# EasyEDA Pro project climbsnail-spotwelder-45c7d2f7.epro, board SpotWelder_Mini
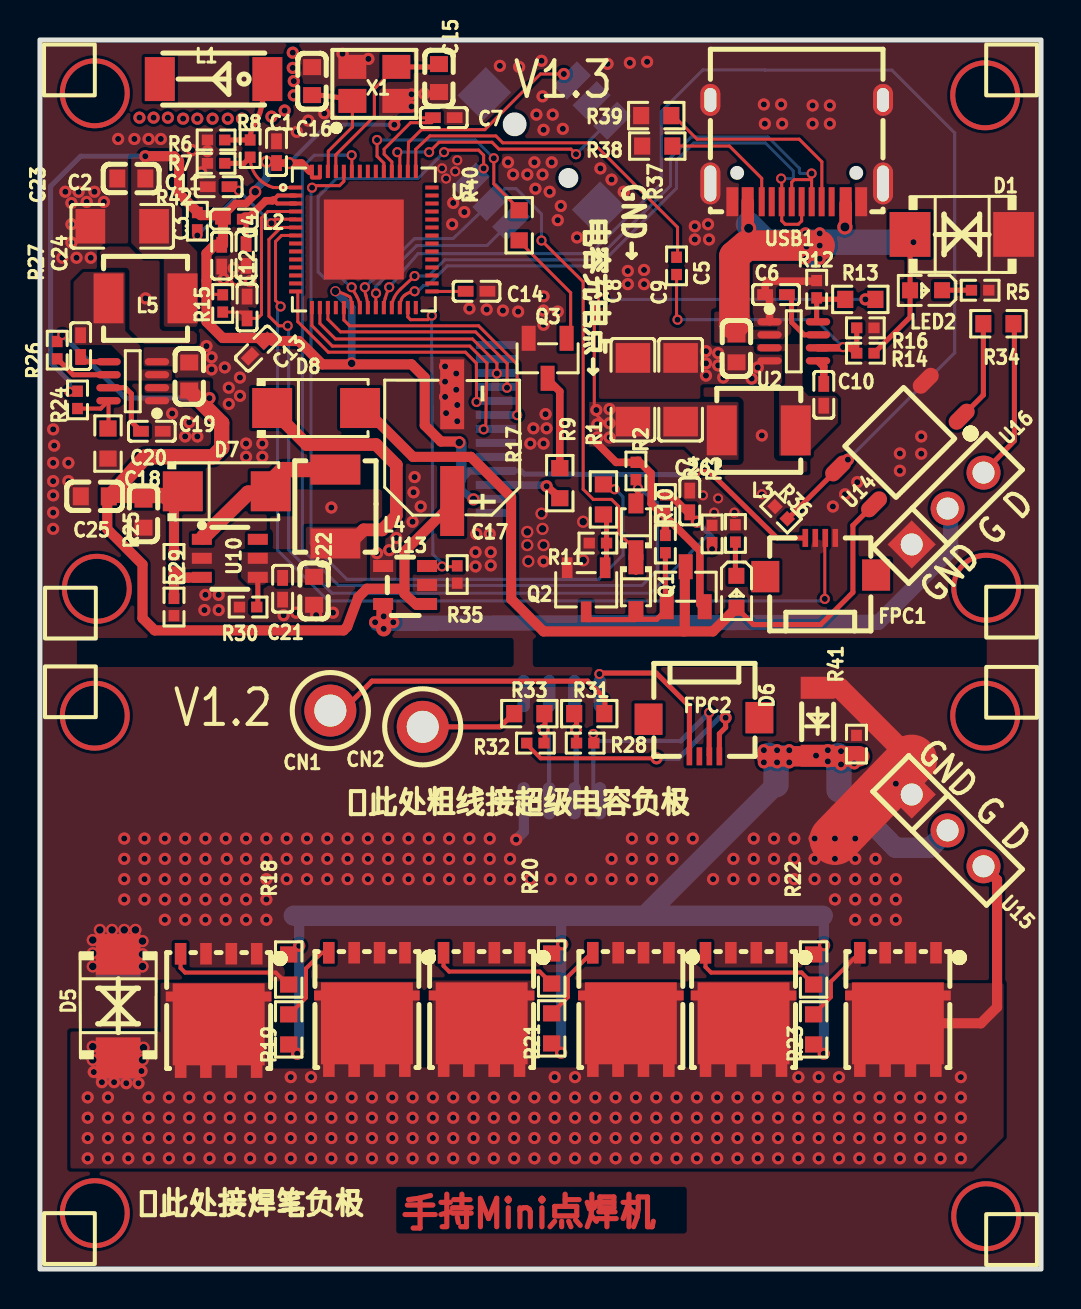
[diagram p14: board, top side]
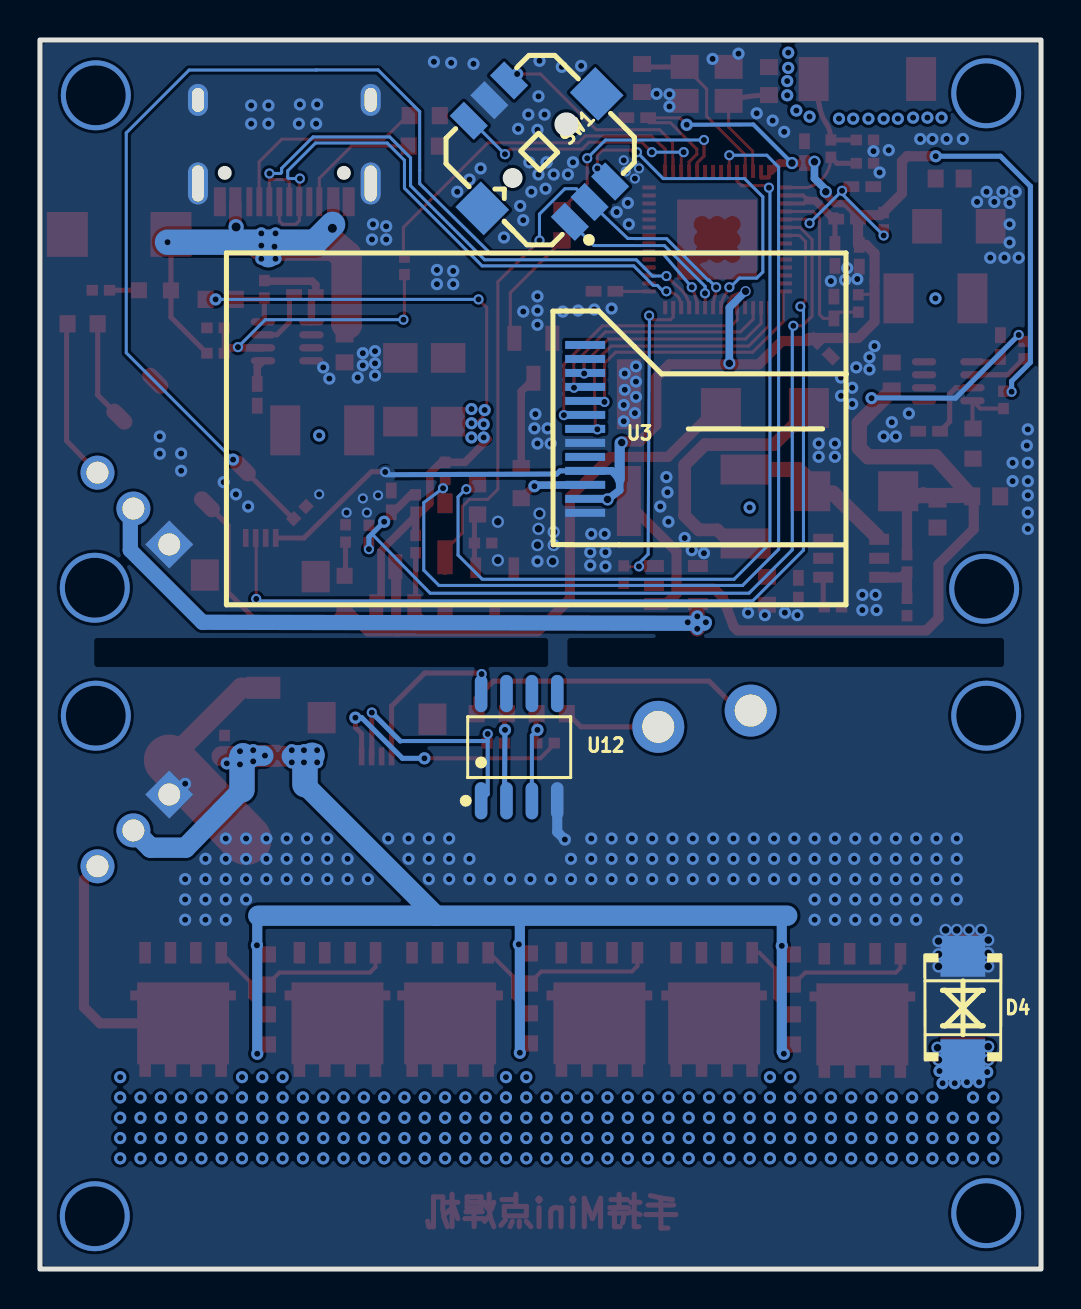
[diagram p15: board, bottom side, seen from below]

Outline 50.09 x 61.49 mm; copper layers: Top Layer, Bottom Layer. Coordinates in mm from the lower left corner of the outline.
Outline path: rectangle 0,61.49 50.09,0
Stack: Top Layer 0.035mm / Dielectric1 1.51mm FR4 er 4.5 / Bottom Layer 0.035mm

## Design rules (mm)
net IO20: DP1
net IO19: DP1
spacing safeClearance (default): track to track 0.152, other pairs 0.152 to 0.3
spacing Plane_innerPlane: track to track 0.152, other pairs 0.152 to 0.3
spacing Copper_copperRegion: track to track 0.152, other pairs 0.152 to 0.3
spacing Copper_GND: track to track 0.152, other pairs 0.152 to 0.3
track width trackWidth (default): min 0.127, default 0.254, max 2.54
differential pair differentialPair (default): width min 0.127, default 0.254, max 2.54; gap min 0.102, default 0.152
net GND uses GND
net $1N673 uses GND
net VBUS uses GND
net $1N86985 uses GND
net 3V3 uses GND
net TFT_DC uses GND
pour e905 uses Copper_GND, copperRegion_Copper_GND
pour e916 uses Copper_GND, copperRegion_Copper_GND
pour e918 uses Copper_copperRegion, copperRegion_Copper_copperRegion
pour e920 uses Copper_GND, copperRegion_Copper_GND
pour e922 uses Copper_GND, copperRegion_Copper_GND
pour e924 uses Copper_copperRegion, copperRegion_Copper_copperRegion
pour e926 uses Copper_GND, copperRegion_Copper_GND
pour e928 uses Copper_copperRegion, copperRegion_Copper_copperRegion
pour e930 uses Copper_copperRegion, copperRegion_Copper_copperRegion
pour e932 uses Copper_copperRegion, copperRegion_Copper_copperRegion
pour e934 uses Copper_GND, copperRegion_Copper_GND
pour e936 uses Copper_GND, copperRegion_Copper_GND
pour e938 uses Copper_GND, copperRegion_Copper_GND

## Placement (name value [footprint] x y rotation side)
C1  100nF  [C0402]  11.84 55.88 90 top
C2  1uF  [C0603]  4.57 54.56 0 top
C3  100nF  [C0402]  9.09 50.7 90 top
C4  100nF  [C0402]  10.31 50.74 90 top
C5  10uF  [C0603]  34.85 46.06 90 top
C6  100nF  [C0402]  36.83 48.76 180 top
C7  100nF  [C0402]  20.2 57.61 180 top
C8  22uF  [C1206]  29.67 43.99 270 top
C9  22uF  [C1206]  32.05 43.99 270 top
C10  100nF  [C0402]  39.22 43.74 270 top
C11  100nF  [C0402]  8.94 54.15 0 top
C12  1uF  [C0402]  10.36 48.11 270 top
C13  100nF  [C0402]  10.9 46.05 225 top
C14  100nF  [C0402]  21.84 48.92 180 top
C15  22pF  [C0603]  19.96 59.59 90 top
C16  22pF  [C0603]  13.61 59.44 90 top
C17  16V/220uF  [CAP-SMD_BD6.3-L6.6-W6.6-FD]  20.62 41.1 90 top
C18  10uF  [C0603]  5.18 37.8 90 top
C19  10uF  [C0603]  7.47 44.65 270 top
C20  100nF  [C0402]  5.6 41.92 0 top
C21  100nF  [C0402]  12.14 34.04 90 top
C22  10uF  [C0603]  13.72 33.93 90 top
C23  22uF  [C1206]  4.11 52.17 0 top
C24  100nF  [C0402]  2.03 46.18 90 top
C25  10uF  [C0603]  2.74 38.66 0 top
C26  1uF  [C0402]  32.51 38.4 270 top
CN1  5006  [TH_BD3.2-D2.0]  14.53 27.94 0 top
CN2  5006  [TH_BD3.2-D2.0]  19.15 27.13 0 top
D1  SMBJ5.0CA  [SMB_L4.6-W3.6-LS5.3-BI]  46.13 51.77 0 top
D2  1N4148WS  [SOD-323_L1.8-W1.3-LS2.5-RD]  29.82 37.13 90 top
D3  1N4148WS  [SOD-323_L1.8-W1.3-LS2.5-RD]  29.82 34.09 270 top
D4  SMBJ28CA双向TVS管  [SMB_L4.6-W3.6-LS5.3-BI]  3.91 13.06 90 bottom
D5  SMBJ28CA双向TVS管  [SMB_L4.6-W3.6-LS5.3-BI]  3.91 13.16 90 top
D6  ZMM18  [LL-34_L3.5-W1.5-RD]  38.91 27.38 90 top
D7  SS34  [SMA_L4.3-W2.6-LS5.2-RD]  9.35 38.91 0 top
D8  SS34  [SMA_L4.3-W2.6-LS5.2-RD]  13.82 43.08 0 top
FPC1  X05A12H04G  [FPC-SMD_4P-P0.50_XKB_X05A12H04G]  39.06 35.61 0 top
FPC2  X05A12H04G  [FPC-SMD_4P-P0.50_XKB_X05A12H04G]  33.22 26.62 180 top
L1  AN2051-245  [ANT2051]  8.69 59.54 180 top
L2  2nH  [L0402]  9.7 52.53 0 top
L3  2.2uH  [IND-SMD_L4.2-W4.2-C133189]  35.97 41.96 0 top
L4  4.7uH  [IND-SMD_L4.5-W4.0-1]  14.78 38.15 90 top
L5  2.2uH  [IND-SMD_L4.2-W4.2-C133189]  5.28 48.56 180 top
LED1  -  [LED0603-RD_BLUE]  34.85 33.88 270 top
LED2  -  [LED0603-RD_BLUE]  44.34 48.97 180 top
Q1  AO3415  [SOT-23-3_L2.9-W1.3-P1.90-LS2.4-BR]  32.31 34.14 270 top
Q2  S8050 J3Y  [SOT-23-3_L3.0-W1.7-P0.95-LS2.9-BR]  27.33 33.99 90 top
Q3  S8050  [SOT-23-3_L2.9-W1.3-P1.90-LS2.4-BR]  25.4 45.57 90 top
R1  10K  [R0402]  29.82 39.93 90 top
R2  200K  [R0402]  31.29 38.3 270 top
R3  10K  [R0402]  34.8 36.8 90 top
R4  200K  [R0402]  33.63 36.78 270 top
R5  10K  [R0402]  47.04 48.97 180 top
R6  TBD  [R0402]  8.81 56.49 0 top
R7  TBD  [R0402]  8.81 55.32 0 top
R8  0R  [R0402]  10.52 56.06 270 top
R9  1K  [R0603]  28.19 38.51 270 top
R10  10K  [R0402]  31.29 36.27 270 top
R11  10K  [R0402]  27.92 36.32 0 top
R12  10K  [R0402]  38.86 49.02 90 top
R13  38.3K  [R0603]  41.05 48.51 0 top
R14  10K  [R0402]  41.3 45.82 0 top
R15  10K  [R0402]  9.14 48.31 90 top
R16  10K  [R0402]  41.3 47.09 180 top
R17  10R  [R0603]  26.01 39.32 90 top
R18  20R  [R0603]  12.45 14.99 270 top
R19  20R  [R0603]  12.45 11.99 90 top
R20  20R  [R0603]  25.6 15.04 270 top
R21  20R  [R0603]  25.6 12.04 90 top
R22  20R  [R0603]  38.71 14.99 270 top
R23  20R  [R0603]  38.71 11.99 90 top
R24  8.87K  [R0603]  3.4 41.3 90 top
R25  200K  [R0402]  6.71 35.31 90 top
R26  40.2K  [R0402]  1.88 43.48 270 top
R27  200K  [R0402]  0.86 45.97 90 top
R28  200K  [R0402]  27.28 26.31 180 top
R29  10K  [R0402]  6.71 33.12 90 top
R30  200K  [R0402]  10.41 33.12 0 top
R31  1K  [R0603]  27.48 27.79 0 top
R32  200K  [R0402]  24.79 26.31 180 top
R33  1K  [R0603]  24.49 27.79 0 top
R34  1K  [R0603]  47.96 47.29 180 top
R35  10K  [R0402]  20.88 34.75 90 top
R36  10K  [R0402]  37.08 37.85 315 top
R37  NC  [R0402]  31.85 50.19 270 top
R38  1K  [R0603]  30.89 56.18 180 top
R39  1K  [R0603]  30.84 57.71 180 top
R40  1K  [R0603]  23.98 52.22 90 top
R41  10K  [R0402]  40.85 26.26 270 top
R42  10K  [R0402]  7.87 52.43 90 top
SW1  TM-4175-B-A  [SW-SMD_TM-4175-B-X]  25.09 55.93 45 bottom
U1  ESP32-S3FH4R2  [QFN-56_L7.0-W7.0-P0.40-TL-EP4.0]  16.21 51.51 0 top
U2  -  [TSOT-23-8_L2.9-W1.6-P0.65-LS2.8-BR]  37.72 46.42 180 top
U3  -  [1.14TFT焊接式B]  25.26 42.03 180 bottom
U4  NCEP30T21GU  [DFN-8_L5.8-W5.1-P1.27-LS5.9-BL]  8.94 12.94 180 top
U5  NCEP30T21GU  [DFN-8_L5.8-W5.1-P1.27-LS5.9-BL]  16.36 12.99 180 top
U6  NCEP30T21GU  [DFN-8_L5.8-W5.1-P1.27-LS5.9-BL]  22.1 12.99 180 top
U7  NCEP30T21GU  [DFN-8_L5.8-W5.1-P1.27-LS5.9-BL]  29.57 12.99 180 top
U8  NCEP30T21GU  [DFN-8_L5.8-W5.1-P1.27-LS5.9-BL]  35.2 12.99 180 top
U9  NCEP30T21GU  [DFN-8_L5.8-W5.1-P1.27-LS5.9-BL]  42.93 12.99 180 top
U10  SX1308  [SOT-23-6_L2.9-W1.6-P0.95-LS2.8-BR]  9.5 35.56 180 top
U11  -  [TSOT-23-8_L2.9-W1.6-P0.65-LS2.8-BR]  4.64 44.42 0 top
U12  GS8332-SR  [SOP-8_L4.9-W3.9-P1.27-LS6.0-BL]  26.11 26.11 180 bottom
U13  UCC27517DBVT  [SOT-23-5_L2.9-W1.6-P0.95-LS2.8-BR]  18.27 34.22 0 top
U14  CT185GB(T1)  [SOP-4_L4.4-W3.6-P2.54-LS7.0-TL]  43.03 41.35 225 top
U15  A2541WV-3P  [HDR-TH_3P-P2.54-V-M]  45.41 21.95 315 top
U16  A2541WV-3P  [HDR-TH_3P-P2.54-V-M]  45.41 38.05 45 top
USB1  TYPEC-304-BCP16  [USB-C-SMD_TYPEC-304-BCP16]  37.86 55.95 180 top
X1  40MHz  [OSC-SMD_4P-L3.2-W2.5-BL_SIT8008BI]  16.73 59.3 0 top

## Footprints (pads in the part's own frame, mm; a bottom-side part is the same pattern mirrored in y, then rotated)
1.14TFT焊接式B
  rect 2x0.4 smd: 1(2.451,4.2) 2(2.451,3.5) 3(2.451,2.8) 4(2.451,2.1) 5(2.451,1.4) 6(2.451,0.7) 7(2.451,0) 8(2.451,-0.7) 9(2.451,-1.4) 10(2.451,-2.1) 11(2.451,-2.8) 12(2.451,-3.5) 13(2.451,-4.2)
ANT2051
  rect 1.5x2.2 smd: 1(-2.69,0) 2(2.69,0)
C0402
  rect 0.79x0.54 smd: 1(-0.545,0) 2(0.545,0)
C0603
  rect 0.8x0.9 smd: 1(-0.7,0) 2(0.7,0)
C1206
  rect 1.485x1.728 smd: 1(-1.593,0) 2(1.593,0)
CAP-SMD_BD6.3-L6.6-W6.6-FD
  rect 3.5x1.2 smd: 1(-2.67,0) 2(2.67,0)
DFN-8_L5.8-W5.1-P1.27-LS5.9-BL
  rect 0.58x1.079 smd: 1(-1.905,-2.834) 2(-0.635,-2.834) 3(0.635,-2.834) 4(1.905,-2.834)
  rect 0.58x1.08 smd: 5(1.9,2.834) 6(0.64,2.834) 7(-0.63,2.834) 8(-1.9,2.834)
  rect 0.95x0.5 smd: 9(-2.169,-0.7) 9(2.169,-0.7)
  rect 4.6x4.1 smd: 9(0,0.695)
FPC-SMD_4P-P0.50_XKB_X05A12H04G
  rect 0.28x0.9 smd: 1(-0.772,0.968) 2(-0.272,0.968) 3(0.228,0.968) 4(0.728,0.968)
  rect 1.4x1.57 smd: 5(-2.772,-0.968) 6(2.772,-0.889)
HDR-TH_3P-P2.54-V-M
  rect 1.7x1.7 hole 1.1: 1(-2.54,0)
  round 1.7 hole 1.1: 2(0,0) 3(2.54,0)
IND-SMD_L4.2-W4.2-C133189
  rect 1.5x2.5 smd: 1(-1.85,0) 2(1.85,0)
IND-SMD_L4.5-W4.0-1
  rect 1.501x2.499 smd: 1(-1.849,0) 2(1.849,0)
L0402
  rect 0.79x0.54 smd: 1(-0.545,0) 2(0.545,0)
LED0603-RD_BLUE
  rect 0.8x0.8 smd: 1(-0.8,-0.003) 2(0.8,0.003)
LL-34_L3.5-W1.5-RD
  rect 1.1x1.7 smd: 1(-1.7,0) 2(1.7,0)
OSC-SMD_4P-L3.2-W2.5-BL_SIT8008BI
  rect 1.399x1.199 smd: 1(-1.1,-0.851) 2(1.1,-0.851) 3(1.1,0.851) 4(-1.1,0.851)
QFN-56_L7.0-W7.0-P0.40-TL-EP4.0
  rect 0.665x0.2 smd: 1(-3.408,2.6) 2(-3.408,2.2) 3(-3.408,1.8) 4(-3.408,1.4) 5(-3.408,1) 6(-3.408,0.6) 7(-3.408,0.2) 8(-3.408,-0.2) 9(-3.408,-0.6) 10(-3.408,-1) 11(-3.408,-1.4) 12(-3.408,-1.8) 13(-3.408,-2.2) 14(-3.408,-2.6) 29(3.408,-2.6) 30(3.408,-2.2) 31(3.408,-1.8) 32(3.408,-1.4) 33(3.408,-1) 34(3.408,-0.6) 35(3.408,-0.2) 36(3.408,0.2) 37(3.408,0.6) 38(3.408,1) 39(3.408,1.4) 40(3.408,1.8) 41(3.408,2.2) 42(3.408,2.6)
  rect 0.2x0.665 smd: 15(-2.6,-3.408) 16(-2.2,-3.408) 17(-1.8,-3.408) 18(-1.4,-3.408) 19(-1,-3.408) 20(-0.6,-3.408) 21(-0.2,-3.408) 22(0.2,-3.408) 23(0.6,-3.408) 24(1,-3.408) 25(1.4,-3.408) 26(1.8,-3.408) 27(2.2,-3.408) 28(2.6,-3.408) 43(2.6,3.408) 44(2.2,3.408) 45(1.8,3.408) 46(1.4,3.408) 47(1,3.408) 48(0.6,3.408) 49(0.2,3.408) 50(-0.2,3.408) 51(-0.6,3.408) 52(-1,3.408) 53(-1.4,3.408) 54(-1.8,3.408) 55(-2.2,3.408) 56(-2.6,3.408)
  rect 4x4 smd: 57(0,0)
R0402
  rect 0.566x0.54 smd: 1(-0.433,0) 2(0.433,0)
R0603
  rect 0.806x0.864 smd: 1(-0.753,0) 2(0.753,0)
SMA_L4.3-W2.6-LS5.2-RD
  rect 2x2 smd: 1(-2.2,0) 2(2.2,0)
SMB_L4.6-W3.6-LS5.3-BI
  rect 2.047x2.241 smd: 1(-2.591,0) 2(2.591,0)
SOD-323_L1.8-W1.3-LS2.5-RD
  rect 1x0.75 smd: 1(-1.173,0) 2(1.173,0)
SOP-4_L4.4-W3.6-P2.54-LS7.0-TL
  oval 1.508x0.8 smd: 1(-3.1,1.27) 2(-3.1,-1.27) 3(3.1,-1.27) 4(3.1,1.27)
SOP-8_L4.9-W3.9-P1.27-LS6.0-BL
  oval 0.63x1.865 smd: 1(-1.905,-2.683) 2(-0.635,-2.683) 3(0.635,-2.683) 4(1.905,-2.683) 5(1.905,2.683) 6(0.635,2.683) 7(-0.635,2.683) 8(-1.905,2.683)
SOT-23-3_L2.9-W1.3-P1.90-LS2.4-BR
  rect 1.25x0.7 smd: 1(1,-0.95) 2(1,0.95) 3(-1,0)
SOT-23-3_L3.0-W1.7-P0.95-LS2.9-BR
  rect 1.038x0.532 smd: 1(1.101,-0.95) 2(1.101,0.95) 3(-1.101,0)
SOT-23-5_L2.9-W1.6-P0.95-LS2.8-BR
  rect 1.001x0.6 smd: 1(1.1,-0.95) 2(1.1,0) 3(1.1,0.95) 4(-1.1,0.95) 5(-1.1,-0.95)
SOT-23-6_L2.9-W1.6-P0.95-LS2.8-BR
  rect 1x0.55 smd: 1(1.4,-0.95) 2(1.4,0) 3(1.4,0.95) 4(-1.4,0.95) 5(-1.4,0) 6(-1.4,-0.95)
SW-SMD_TM-4175-B-X
  rect 1.7x1 smd: 1(-3.575,1.425) 2(-3.575,0.028) 3(-3.575,-1.425) 4(3.575,1.425) 5(3.575,-0.028) 6(3.575,-1.425)
  rect 2x1.8 smd: 7(0,-4.05) 7(0,4.05)
TH_BD3.2-D2.0
  round 2.6 hole 1.6: 1(0,0)
TSOT-23-8_L2.9-W1.6-P0.65-LS2.8-BR
  oval 1.222x0.363 smd: 1(1.212,-0.976) 2(1.212,-0.325) 3(1.212,0.325) 4(1.212,0.976) 5(-1.212,0.976) 6(-1.212,0.325) 7(-1.212,-0.325) 8(-1.212,-0.976)
USB-C-SMD_TYPEC-304-BCP16
  oval 1.001x2.1 hole 0.6x1.801: 13(-4.321,1.633) 14(4.321,1.633)
  oval 1.001x1.6 hole 0.6x1.199: 15(-4.321,-2.547) 16(4.321,-2.547)
  rect 0.6x1.45 smd: A1B12(-3.226,2.547) A4B9(-2.451,2.547) B1A12(3.22,2.547) B4A9(2.451,2.547)
  rect 0.299x1.45 smd: A5(-1.25,2.547) A6(-0.249,2.547) A7(0.249,2.547) A8(1.25,2.547) B5(1.75,2.547) B6(0.75,2.547) B7(-0.75,2.547) B8(-1.75,2.547)

## Nets
As in the schematic.

Pads without a net: FPC1 2 5 6; FPC2 3 5 6; L1 2; SW1 7; U1 8 9 10 11 12 13 28 30 31 32 33 34 35 36 37 38 39 40 41 42 48 49 50; U3 1 2 9; U10 6; U12 5 6 7; USB1 A8 B8

## Via types
v1: diameter 0.61, hole 0.305, Top Layer to Bottom Layer, 531 vias
v2: diameter 3.5, hole 3, Top Layer to Bottom Layer, 8 vias
v3: diameter 0.508, hole 0.305, Top Layer to Bottom Layer, 52 vias
v4: diameter 0.61, hole 0.381, Top Layer to Bottom Layer, 28 vias
v5: diameter 0.762, hole 0.457, Top Layer to Bottom Layer, 2 vias
v6: diameter 0.508, hole 0.381, Top Layer to Bottom Layer, 1 via

## Routing (per net, layer and track width the routed paths; a pad name or vN(x,y) marks a point on that pad's centre or on a via; arc(x,y) is an arc through that point)
3V3: length 1.3
  Top Layer w0.152: v6(14.78,48.92) arc(15.14,48.82) 15.48,48.66 arc(15.52,48.62) 15.54,48.56 arc(15.59,48.34) U1.20
  vias: v1(5.27,55.68) v1(17.73,57.25) v3(1.47,43.89) v3(32.82,39.88) v4(10.77,53.9) v4(11.34,55.4) v4(12.46,55.33) v4(15.6,45.31) v4(20.98,41.35) v4(21.69,38.51)
+12V:
  vias: v1(8.48,43.57) v3(1.12,46.74)
AGND:
  vias: v1(30.85,25.55) v1(34.31,27.58)
GND:
  vias: v1(0.66,42.01) v1(0.66,40.34) v1(0.66,39.42) v1(0.66,38.71) v1(0.66,37.85) v1(0.66,37.03) v1(0.71,41.2) v1(1.12,50.6) v1(1.27,53.9) v1(1.42,40.34) v1(1.42,39.42) v1(1.57,53.34) v1(1.57,52.27) v1(1.57,51.36) v1(1.83,50.6) v1(1.93,53.9) v1(2.34,53.39) v1(2.54,50.6) v1(2.72,53.9) v1(3.2,53.39) v1(3.91,56.54) v1(4.22,21.54) v1(4.22,20.52) v1(4.22,19.51) v1(4.22,18.49) v1(4.72,56.54) v1(5.23,21.54) v1(5.23,20.52) v1(5.23,19.51) v1(5.23,18.49) v1(5.44,56.54) v1(6.04,56.54) v1(6.25,21.54) v1(6.25,20.52) v1(6.25,19.51) v1(6.25,18.49) v1(6.25,17.48) v1(6.61,42.8) v1(7.26,41.66) v1(7.26,21.54) v1(7.26,20.52) v1(7.26,19.51) v1(7.26,18.49) v1(7.26,17.48) v1(7.47,42.37) v1(7.62,55.98) v1(7.87,41.66) v1(8.08,54.86) v1(8.28,33.73) v1(8.23,32.97) v1(8.28,21.54) v1(8.28,20.52) v1(8.28,19.51) v1(8.28,18.49) v1(8.28,17.48) v1(8.38,55.93) v1(8.33,46.18) v1(8.59,45.62) v1(8.59,45.01) v1(8.94,33.73) v1(8.94,32.97) v1(9.19,49.53) v1(9.25,45.11) v1(9.3,21.54) v1(9.3,19.51) v1(9.3,18.49) v1(9.3,17.48) v1(9.35,20.52) v1(9.45,44.09) v1(9.45,43.28) v1(9.7,50.08) v1(9.8,49.48) v1(10.01,44.6) v1(10.01,43.69) v1(10.31,41.3) v1(10.31,40.64) v1(10.31,21.54) v1(10.31,20.52) v1(10.31,19.51) v1(10.31,18.49) v1(10.31,17.48) v1(10.52,49.43) v1(11.12,41.3) v1(11.12,40.64) v1(11.33,21.54) v1(11.33,20.52) v1(11.33,19.51) v1(11.33,18.49) v1(11.33,17.48) v1(12.19,32.72) v1(12.34,21.54) v1(12.34,20.52) v1(12.34,19.51) v1(12.85,56.9) v1(12.82,32.84) v1(13.36,21.54) v1(13.36,20.52) v1(13.36,19.51) v1(13.43,57.46) v1(13.82,32.72) v1(14.23,57.82) v1(14.38,21.54) v1(14.38,20.52) v1(14.38,19.51) v1(14.66,32.84) v1(15.14,60.81) v1(15.39,21.54) v1(15.39,20.52) v1(15.39,19.51) v1(16.43,60.55) v1(16.41,21.54) v1(16.41,20.52) v1(16.41,19.51) v1(16.87,35.81) v1(17.47,35.97) v1(17.42,21.54) v1(17.42,20.52) v1(17.42,19.51) v1(17.83,36.58) v1(18.44,21.54) v1(18.44,20.52) v1(18.44,19.51) v1(18.59,58.78) v1(18.59,58.17) v1(18.69,38.86) v1(18.64,37.39) v1(18.75,39.62) v1(19.05,38.15) v1(19.24,58.8) v1(19.46,21.54) v1(19.46,20.52) v1(19.46,19.51) v1(20.27,45.16) v1(20.27,44.4) v1(20.27,43.64) v1(20.32,42.82) v1(20.47,21.54) v1(20.47,20.52) v1(20.47,19.51) v1(20.68,53.34) v1(20.62,52.27) v1(20.83,44.81) v1(20.83,43.99) v1(20.88,43.23) v1(20.88,42.42) v1(21.23,52.88) v1(21.49,48.06) v1(21.49,21.54) v1(21.49,20.52) v1(21.49,19.51) v1(21.79,35.86) v1(21.79,35.15) v1(21.83,36.78) v1(22.35,48.01) v1(22.5,36.78) v1(22.5,21.54) v1(22.5,20.52) v1(22.5,19.51) v1(22.56,35.86) v1(22.56,35.2) v1(23.01,60.2) v1(23.16,47.96) v1(23.42,55.37) v1(23.52,20.52) v1(23.52,19.51) v1(23.67,54.76) v1(23.82,21.49) v1(23.98,60.15) v1(23.93,47.9) v1(24.38,54.76) v1(24.54,41.3) v1(24.54,19.51) v1(24.69,42.06) v1(24.74,55.37) v1(24.79,54.05) v1(24.84,57.76) v1(25.09,60.45) v1(25.15,58.67) v1(25.2,57) v1(25.15,54.76) v1(25.2,48.67) v1(25.2,47.96) v1(25.2,47.24) v1(25.2,41.3) v1(25.2,35.41) v1(25.3,42.77) v1(25.35,42.06) v1(25.5,53.9) v1(25.6,55.37) v1(25.55,19.51) v1(25.65,57.76) v1(25.91,52.48) v1(25.91,47.9) v1(26.06,53.19) v1(26.16,57.05) v1(26.57,19.51) v1(26.87,51.61) v1(27.58,19.51) v1(28.04,55.07) v1(28.4,60.3) v1(28.6,54.51) v1(28.6,20.52) v1(28.6,19.51) v1(29.21,53.9) v1(29.41,49.94) v1(29.41,49.28) v1(29.51,60.35) v1(29.62,21.54) v1(29.62,20.52) v1(29.62,19.51) v1(30.23,49.99) v1(30.23,49.28) v1(30.38,60.4) v1(30.63,21.54) v1(30.63,20.52) v1(30.63,19.51) v1(31.65,21.54) v1(31.65,20.52) v1(32.66,21.54) v1(32.77,52.17) v1(32.77,51.51) v1(33.32,45.92) v1(33.32,45.31) v1(33.32,44.7) v1(33.43,52.27) v1(33.48,51.51) v1(33.68,19.51) v1(33.93,45.82) v1(33.93,45.21) v1(34.19,44.6) v1(34.7,20.52) v1(34.7,19.51) v1(35.61,44.55) v1(35.71,21.54) v1(35.71,20.52) v1(35.71,19.51) v1(35.92,45.11) v1(36.22,58.27) v1(36.27,57.3) v1(36.73,21.54) v1(36.73,20.52) v1(36.73,19.51) v1(37.08,58.27) v1(37.13,57.3) v1(37.74,21.54) v1(37.74,20.52) v1(37.74,19.51) v1(38.66,58.22) v1(38.66,57.3) v1(38.76,21.54) v1(38.76,20.52) v1(38.76,19.51) v1(39.52,58.22) v1(39.52,57.3) v1(39.67,38.15) v1(39.78,21.54) v1(39.78,20.52) v1(39.78,19.51) v1(39.78,18.49) v1(40.28,38.76) v1(40.79,21.54) v1(40.79,20.52) v1(40.79,19.51) v1(40.79,18.49) v1(40.79,17.48) v1(40.89,39.37) v1(41.81,20.52) v1(41.81,19.51) v1(41.81,18.49) v1(41.81,17.48) v1(42.82,24.28) v1(42.82,19.51) v1(42.82,18.49) v1(42.82,17.48) v1(43.03,40.8) v1(43.03,39.94) v1(44.09,41.66) v1(44.09,40.79) v3(20.12,55.07) v3(20.32,54.56) v3(20.78,54.91) v3(20.88,55.47) v3(33.17,38.71) v3(33.73,37.85) v3(33.93,38.56) v3(34.75,37.85) v3(36.12,38.76) v4(2.64,16.46) v4(2.64,15.8) v4(2.64,15.14) v4(3,16.97) v4(3.61,16.97) v4(4.22,16.97) v4(4.78,16.97) v4(5.13,16.41) v4(5.13,15.75) v4(5.13,15.14) v4(24.38,36.88) v4(24.38,36.22) v4(24.43,35.41) v4(25.09,37.8) v4(25.15,37.03) v4(25.2,36.22) v4(27.18,37.39) v4(27.18,35.46)
VBUS: length 6.4
  Top Layer w0.254: R14.2 43.54,47.62 LED2.2 43.54,51.21 v1(43.7,51.38)
  vias: v1(38.3,51.82) v1(38.3,50.55) v1(38.35,51.16) v1(39.01,51.82) v1(39.01,51.21) v1(39.01,50.55) v5(35.46,52.07) v5(40.28,52.14)
(no net):
  vias: v1(4.98,57.61) v1(5.69,57.61) v1(6.4,57.61) v1(7.16,57.56) v1(7.87,57.56) v1(8.64,57.56) v1(9.4,57.56) v1(10.11,57.56) v1(11.58,57.66) v1(12.24,57.96) v1(12.65,60.86) v1(12.65,60.1) v1(12.7,59.44) v1(12.7,58.72) v2(2.74,58.83) v2(2.74,27.69) v2(2.74,2.79) v2(2.84,34.04) v2(47.29,58.72) v2(47.29,27.69) v2(47.35,34.09) v2(47.35,2.64)
+CAP: length 2.6
  Top Layer w0.381: 27.66,41.53 28.83,40.36 R1.2
  vias: v1(27.84,42.98) v1(27.89,42.27) v1(27.89,41.61) v1(28.5,43.03) v1(28.5,42.32) v1(28.5,41.61) v1(41.3,48.51) v3(28.15,48.51)
A_3V3:
  vias: v3(27.99,29.77)
BOOT: length 1.3
  Top Layer w0.152: v3(11.58,52.32) 11.79,52.53 12.78,52.53 U1.5
  vias: v3(7.87,51.71) v3(9.96,53.95)
CAP_VOL: length 1.7
  Bottom Layer w0.254: v1(32.87,37.39) 33.63,36.63 v3(33.63,36.02)
  vias: v3(12.4,47.19)
CUR_VOL:
  vias: v3(12.04,48.16) v3(27.69,26.77) v3(33.48,27.84) v3(39.27,33.53)
ENTER: length 2.1
  Top Layer w0.152: U1.22 arc(16.38,48.41) 16.31,48.72 arc(16.26,48.92) v3(16.26,49.12)
  Top Layer w0.254: D2.1 29.82,34.85
  vias: v3(25.09,51.46)
IO19: length 26.5
  Top Layer w0.152: v3(18.75,49.68) arc(18.39,49.35) 18.03,49.02 arc(17.86,48.83) 17.73,48.62 arc(17.64,48.37) U1.25
  Bottom Layer w0.152: v3(38.61,54.81) 38.05,54.81 38,54.87 38,55.07 36.43,56.64 32.59,56.64 31.55,55.6 31.55,54.2 27.84,50.5 20.25,50.5 19.44,49.68 v3(18.75,49.68)
IO20: length 25.6
  Top Layer w0.152: U1.26 arc(18.03,48.31) 18.08,48.51 arc(18.15,48.63) 18.24,48.72 arc(18.48,48.86) v3(18.75,48.92)
  Bottom Layer w0.152: v3(18.75,48.92) 18.91,48.92 19.2,49.21 19.4,49.21 20.38,50.19 27.96,50.19 31.85,54.08 31.85,55.47 32.72,56.34 36.3,56.34 37.69,54.94 37.69,54.61 37.64,54.56 v3(37.08,54.56)
KEY_D:
  vias: v1(26.21,59.79)
KEY_L: length 1.1
  Top Layer w0.152: v3(15.6,49.12) arc(15.72,48.89) 15.85,48.67 arc(15.97,48.4) U1.21
  vias: v3(20.22,55.88) v3(22.2,55.07)
KEY_R:
  vias: v3(17.88,55.88) v3(19.47,55.88) v3(26.82,55.78)
KEY_UP:
  vias: v3(16.81,48.82)
MOS_D2:
  vias: v1(2.39,8.59) v1(2.39,7.57) v1(2.39,6.55) v1(2.39,5.54) v1(2.69,9.86) v1(3.1,9.35) v1(3.4,8.59) v1(3.4,7.57) v1(3.4,6.55) v1(3.4,5.54) v1(3.71,9.35) v1(4.32,9.3) v1(4.42,7.57) v1(4.42,6.55) v1(4.42,5.54) v1(4.93,9.3) v1(5.08,9.91) v1(5.44,8.59) v1(5.44,7.57) v1(5.44,6.55) v1(5.44,5.54) v1(6.45,8.59) v1(6.45,7.57) v1(6.45,6.55) v1(6.45,5.54) v1(7.47,8.59) v1(7.47,7.57) v1(7.47,6.55) v1(7.47,5.54) v1(8.48,8.59) v1(8.48,7.57) v1(8.48,6.55) v1(8.48,5.54) v1(9.5,8.59) v1(9.5,7.57) v1(9.5,6.55) v1(9.5,5.54) v1(10.52,8.59) v1(10.52,7.57) v1(10.52,6.55) v1(10.52,5.54) v1(11.53,8.59) v1(11.53,7.57) v1(11.53,6.55) v1(11.53,5.54) v1(12.55,9.6) v1(12.55,8.59) v1(12.55,7.57) v1(12.55,6.55) v1(12.55,5.54) v1(13.56,9.6) v1(13.56,8.59) v1(13.56,7.57) v1(13.56,6.55) v1(13.56,5.54) v1(14.58,8.59) v1(14.58,7.57) v1(14.58,6.55) v1(14.58,5.54) v1(15.6,8.59) v1(15.6,7.57) v1(15.6,6.55) v1(15.6,5.54) v1(16.61,8.59) v1(16.61,7.57) v1(16.61,6.55) v1(16.61,5.54) v1(17.63,8.59) v1(17.63,7.57) v1(17.63,6.55) v1(17.63,5.54) v1(18.64,8.59) v1(18.64,7.57) v1(18.64,6.55) v1(18.64,5.54) v1(19.66,8.59) v1(19.66,7.57) v1(19.66,6.55) v1(19.66,5.54) v1(20.68,8.59) v1(20.68,7.57) v1(20.68,6.55) v1(20.68,5.54) v1(21.69,8.59) v1(21.69,7.57) v1(21.69,6.55) v1(21.69,5.54) v1(22.71,8.59) v1(22.71,7.57) v1(22.71,6.55) v1(22.71,5.54) v1(23.72,8.59) v1(23.72,7.57) v1(23.72,6.55) v1(23.72,5.54) v1(24.74,8.59) v1(24.74,7.57) v1(24.74,6.55) v1(24.74,5.54) v1(25.76,9.6) v1(25.76,8.59) v1(25.76,7.57) v1(25.76,6.55) v1(25.76,5.54) v1(26.77,9.6) v1(26.77,8.59) v1(26.77,7.57) v1(26.77,6.55) v1(26.77,5.54) v1(27.79,8.59) v1(27.79,7.57) v1(27.79,6.55) v1(27.79,5.54) v1(28.8,8.59) v1(28.8,7.57) v1(28.8,6.55) v1(28.8,5.54) v1(29.82,8.59) v1(29.82,7.57) v1(29.82,6.55) v1(29.82,5.54) v1(30.84,8.59) v1(30.84,7.57) v1(30.84,6.55) v1(30.84,5.54) v1(31.85,8.59) v1(31.85,7.57) v1(31.85,6.55) v1(31.85,5.54) v1(32.87,8.59) v1(32.87,7.57) v1(32.87,6.55) v1(32.87,5.54) v1(33.88,8.59) v1(33.88,7.57) v1(33.88,6.55) v1(33.88,5.54) v1(34.9,8.59) v1(34.9,7.57) v1(34.9,6.55) v1(34.9,5.54) v1(35.92,8.59) v1(35.92,7.57) v1(35.92,6.55) v1(35.92,5.54) v1(36.93,8.59) v1(36.93,7.57) v1(36.93,6.55) v1(36.93,5.54) v1(37.95,9.6) v1(37.95,8.59) v1(37.95,7.57) v1(37.95,6.55) v1(37.95,5.54) v1(38.96,9.6) v1(38.96,8.59) v1(38.96,7.57) v1(38.96,6.55) v1(38.96,5.54) v1(39.98,9.6) v1(39.98,8.59) v1(39.98,7.57) v1(39.98,6.55) v1(39.98,5.54) v1(41,8.59) v1(41,7.57) v1(41,6.55) v1(41,5.54) v1(42.01,8.59) v1(42.01,7.57) v1(42.01,6.55) v1(42.01,5.54) v1(43.03,8.59) v1(43.03,7.57) v1(43.03,6.55) v1(43.03,5.54) v1(44.04,8.59) v1(44.04,7.57) v1(44.04,6.55) v1(44.04,5.54) v1(45.06,8.59) v1(45.06,7.57) v1(45.06,6.55) v1(45.06,5.54) v1(46.08,9.6) v1(46.08,8.59) v1(46.08,7.57) v1(46.08,6.55) v1(46.08,5.54) v4(2.64,11.13) v4(2.64,10.46) v4(5.18,11.07) v4(5.13,10.46)
MOS_G:
  vias: v1(16.77,32.36) v1(17.2,32.66) v1(17.2,32.03) v1(17.68,32.36)
MOS_G2: length 0.9
  Top Layer w0.254: v1(39.42,25.4) 39.93,25.91 v1(40.08,25.91)
  vias: v1(12.87,10.77) v1(12.97,16.17) v1(26.08,10.82) v1(26.13,16.24) v1(36.22,25.96) v1(36.22,25.35) v1(36.88,25.96) v1(36.88,25.35) v1(37.49,25.96) v1(37.49,25.35) v1(38.83,25.69) v1(39.23,16.2) v1(39.22,10.77) v1(39.42,25.96) v1(40.08,25.25) v1(40.74,25.3)
MOS_SW:
  vias: v3(19.61,47.7) v3(20.12,35.15)
NONE1:
  vias: v1(5.28,48.56)
NONE2:
  vias: v1(14.58,38.1)
NONE3:
  vias: v1(36.12,41.71)
POWER_CHECK: length 1.3
  Top Layer w0.254: R1.1 29.92,39.39 v3(29.92,39.07) 29.92,38.41 D2.2
  vias: v3(15.6,55.73)
SHORT_EN: length 1.1
  Top Layer w0.152: v3(17.47,49.12) arc(17.36,48.85) 17.27,48.56 arc(17.22,48.34) U1.24
  vias: v1(40.43,40.5)
START_POWER_EN:
  vias: v3(13.61,54.1) v3(28.75,39.01)
TFT_BL:
  vias: v3(16.87,56.49) v3(22.71,55.58)
TFT_CS:
  vias: v3(22.2,42.01)
TFT_DC:
  vias: v3(21.84,43.38)
TFT_MOSI:
  vias: v3(22.86,44.81)
TFT_RST:
  vias: v3(23.88,42.72)
TFT_SCLK:
  vias: v3(23.37,44.09)
XTAL_N: length 2.3
  Top Layer w0.254: X1.3 arc(18.97,60.14) 20.12,60.14
XTAL_P: length 6.1
  Top Layer w0.152: U1.54 14.43,54.94 14.43,55.93 15.63,57.13 X1.1
  Top Layer w0.254: C16.1 arc(14.63,58.66) X1.1
$1N89886: length 7.1
  Top Layer w0.254: 31.29,35.81 31.29,33.06 31.35,33 30.86,32.51 29.82,32.51 29.81,32.49 27.35,32.49
$1N90159: length 1.5
  Top Layer w0.254: 28.35,36.32 28.35,37.6 R9.2
$1N102735: length 1.4
  Top Layer w0.254: C4.2 10.31,52.61 10.25,52.68
$1N111735: length 4.6
  Top Layer w0.152: U1.1 11.67,54.11 arc(11.55,54.15) 11.43,54.2 arc(10.76,54.78) R8.2
  Top Layer w0.254: R7.2 10.21,55.32 R8.2
$1N112405: length 4.5
  Top Layer w0.254: R6.2 10.51,56.49 10.52,56.49 arc(10.58,56.94) 10.77,57.35 arc(10.96,57.72) 11.07,58.12 arc(11.22,58.83) L1.1
$1N115607: length 1.7
  Top Layer w0.254: R3.1 34.8,34.73 34.85,34.68
$1N115916: length 1.5
  Top Layer w0.254: LED2.1 46.61,48.97
$1N135994:
  vias: v1(25.2,26.97)
$1N136281:
  vias: v1(26.82,26.97)
$1N154799: length 3.5
  Top Layer w0.254: 47.2,43.78 R34.2
$1N164036: length 1.3
  Top Layer w0.254: R16.2 R14.1
  vias: v3(31.9,47.5) v3(40.18,46.13)
$1N183266:
  vias: v1(25.35,39.17)

## Copper pours and planes (outline as drawn; the poured copper is in the pictures)
3V3 on Top Layer: 6.2,47.14 7.87,47.14 7.87,50.9 7.11,51.66 7.11,53.04 6.4,53.75 6.4,55.63 4.58,55.63 4.56,55.64 4.56,51.34 5.24,50.66 6.2,50.66
+12V on Top Layer: 5.23,43.84 6.62,43.84 7.2,43.26 8.51,43.26 8.51,44.45 6.97,44.45 6.87,44.35 5.23,44.35
GND on Top Layer: 28.91,50.5 30.73,50.5 30.73,48.72 28.91,48.72
GND on Top Layer: -4.32,68.33 58.88,68.33 58.88,-5.69 -4.32,-5.69
GND on Top Layer: 8.03,16.87 8.03,15.28 11.47,15.28 11.47,16.88 15.13,16.88 15.13,15.31 18.97,15.31 18.97,16.87 21.03,16.87 21.03,15.34 24.7,15.34 24.7,16.85 28.33,16.85 28.35,16.87 28.35,15.34 32.22,15.34 32.22,16.87 34.03,16.87 34.04,15.31 37.87,15.31 37.87,16.85 41.72,16.85 41.72,15.3 45.63,15.3 45.63,19.05 42.78,21.9 3.25,21.9 1.83,20.47 1.83,14.72 2.08,14.47 5.54,14.47 5.54,16.87
GND on Bottom Layer: -3.53,70.15 52.81,70.15 52.81,-6.53 -3.53,-6.53
VBUS on Top Layer: 37.24,46.99 37.24,46.52 35.73,46.52 35.56,46.34 33.73,46.34 33.73,47.9 35.33,47.9 35.56,47.67 35.56,47.14 35.71,46.99
+CAP on Top Layer: 27.48,43.38 34.95,43.38 34.95,40.49 27.48,40.49
MOS_D2 on Top Layer: 5.99,14.33 11.51,14.33 11.54,14.29 11.54,10.03 13.75,10.03 13.81,10.09 13.76,10.14 13.76,14.37 18.93,14.37 18.96,14.34 18.96,10.08 19.63,10.08 19.63,14.44 24.68,14.44 24.7,14.42 24.7,10.08 27.01,10.08 27.02,10.09 27.02,14.28 26.97,14.33 32.16,14.33 32.16,10.18 32.07,10.08 32.65,10.08 32.65,10.09 32.65,14.34 32.6,14.39 37.76,14.39 37.8,14.44 37.8,10.08 40.33,10.08 40.33,14.3 48.22,14.3 48.22,6.61 46.64,5.03 1.52,5.03 1.52,11.89 5.97,11.89 6.03,11.83 6.03,14.29
NONE1 on Top Layer: 4.57,51.16 5.18,50.55 6.1,50.55 6.1,46.99 7.63,46.99 7.85,46.77 7.85,46.36 7.77,46.28 5.13,46.28 4.42,46.99 4.42,49.99 4.36,50.05 3,50.05 3,50.9 3.27,51.16
NONE2 on Top Layer: 11.51,37.66 11.51,35.79 11.53,35.76 13.03,35.76 13.21,35.94 13.21,37.13 16.1,37.13 16.31,36.93 16.31,36.17 17.12,36.17 17.12,38.91 17.02,39.01 12.75,39.01 12.65,38.91 12.65,37.74 12.57,37.66
NONE3 on Top Layer: 33.2,44.11 36.89,44.11 36.89,40.51 38.36,40.51 38.39,40.48 38.39,39.89 38.4,39.88 34.34,39.88 34.32,39.86 33.99,40.2 33.99,40.28 35,40.28 35.1,40.39 35.1,43.43 35.05,43.48 33.2,43.48
$1N673 on Top Layer: 10.05,35.86 13.18,35.86 13.3,35.99 13.3,37.13 16.36,37.13 16.36,34.34 11.33,34.34 11.23,34.24 10.42,34.24 10.05,34.61
$1N80208 on Top Layer: 35.86,46.28 39.93,46.28 39.93,40.69 35.86,40.69
$1N86985 on Top Layer: 6.6,45.01 6.6,44.45 4.27,44.45 4.27,45.52 3.56,46.23 1.73,46.23 1.68,46.18 1.68,49.39 2.18,49.89 4.27,49.89 4.27,46.94 5.03,46.18 5.03,45.01

## Text on the board
Document Layer: V1.3 新增了GPIO0的R42上拉电阻，避免第一次无法开机。
Top Layer: 手持Mini点焊机
Top Solder Mask Layer: 手持Mini点焊机
Top Silkscreen Layer: GND G D | V1.2 | V1.3 | 电容充电点→ | GND→ | ⬆此处接焊笔负极 | ⬇此处粗线接超级电容负极
